# Altium project esc55a.PrjPcb
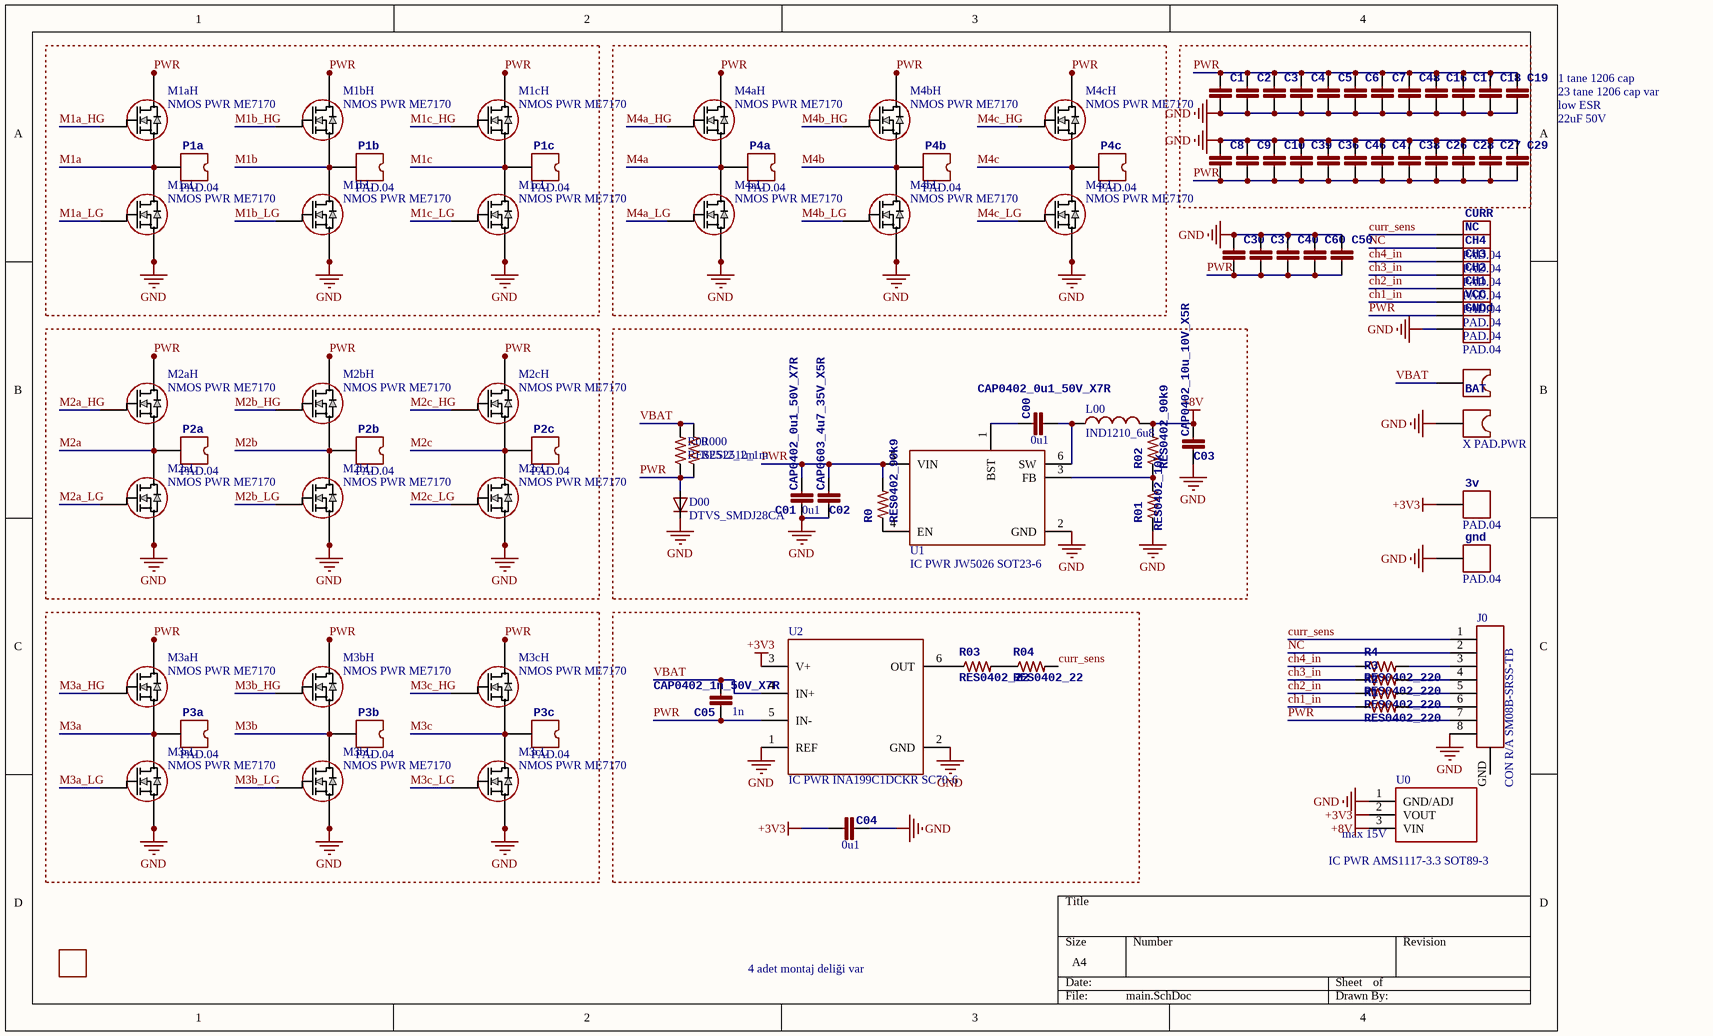
[diagram p0: main.SchDoc]
3 sheets, 232 parts. Net scope: global (net labels, ports and power ports of the same name join across sheets).
Board files: ESC_v0.PcbDoc, escPan.PcbDoc
Sheets:
  main.SchDoc
  mcu.SchDoc
  mcu2.SchDoc

## Sheet main.SchDoc
size A4; SheetNumber: 1; SheetTotal: 3

### Parts
3v  PAD.04  [PAD.04X.04]  (no BOM)
BAT  X PAD.PWR  [PAD6x8]  (no BOM)
C00  CAP0402_0u1_50V_X7R  value 0u1  [0402-CAP]
C1  CAP1206_22u_35V_X5R  [1206-CAP]  (value not drawn)
C01  CAP0402_0u1_50V_X7R  value 0u1  [0402-CAP]
C2  CAP1206_22u_35V_X5R  [1206-CAP]  (value not drawn)
C02  CAP0603_4u7_35V_X5R  [0603-CAP]
C3  CAP1206_22u_35V_X5R  [1206-CAP]  (value not drawn)
C03  CAP0402_10u_10V_X5R  [0402-CAP]
C4  CAP1206_22u_35V_X5R  [1206-CAP]  (value not drawn)
C04  value 0u1  [0402-CAP]  (hidden comment: CAP0402_0u1_16V_X7R)
C5  CAP1206_22u_35V_X5R  [1206-CAP]  (value not drawn)
C05  CAP0402_1n_50V_X7R  value 1n  [0402-CAP]
C6  CAP1206_22u_35V_X5R  [1206-CAP]  (value not drawn)
C7  CAP1206_22u_35V_X5R  [1206-CAP]  (value not drawn)
C8  CAP1206_22u_35V_X5R  [1206-CAP]  (value not drawn)
C9  CAP1206_22u_35V_X5R  [1206-CAP]  (value not drawn)
C10  CAP1206_22u_35V_X5R  [1206-CAP]  (value not drawn)
C16  CAP1206_22u_35V_X5R  [1206-CAP]  (value not drawn)
C17  CAP1206_22u_35V_X5R  [1206-CAP]  (value not drawn)
C18  CAP1206_22u_35V_X5R  [1206-CAP]  (value not drawn)
C19  CAP1206_22u_35V_X5R  [1206-CAP]  (value not drawn)
C26  CAP1206_22u_35V_X5R  [1206-CAP]  (value not drawn)
C27  CAP1206_22u_35V_X5R  [1206-CAP]  (value not drawn)
C28  CAP1206_22u_35V_X5R  [1206-CAP]  (value not drawn)
C29  CAP1206_22u_35V_X5R  [1206-CAP]  (value not drawn)
C30  CAP1206_22u_35V_X5R  [1206-CAP]  (value not drawn)
C36  CAP1206_22u_35V_X5R  [1206-CAP]  (value not drawn)
C37  CAP1206_22u_35V_X5R  [1206-CAP]  (value not drawn)
C38  CAP1206_22u_35V_X5R  [1206-CAP]  (value not drawn)
C39  CAP1206_22u_35V_X5R  [1206-CAP]  (value not drawn)
C40  CAP1206_22u_35V_X5R  [1206-CAP]  (value not drawn)
C46  CAP1206_22u_35V_X5R  [1206-CAP]  (value not drawn)
C47  CAP1206_22u_35V_X5R  [1206-CAP]  (value not drawn)
C48  CAP1206_22u_35V_X5R  [1206-CAP]  (value not drawn)
C50  CAP1206_22u_35V_X5R  [1206-CAP]  (value not drawn)
C60  CAP1206_22u_35V_X5R  [1206-CAP]  (value not drawn)
CH1  PAD.04  [PAD.04X.04]  (no BOM)
CH2  PAD.04  [PAD.04X.04]  (no BOM)
CH3  PAD.04  [PAD.04X.04]  (no BOM)
CH4  PAD.04  [PAD.04X.04]  (no BOM)
CURR  PAD.04  [PAD.04X.04]  (no BOM)
D00  DTVS_SMDJ28CA  [SMC-TVS]
gnd  PAD.04  [PAD.04X.04]  (no BOM)
GNDd  PAD.04  [PAD.04X.04]  (no BOM)
J0  CON R/A SM08B-SRSS-TB  [JST_SM08B-SRSS-TB]
L00  IND1210_6u8  [1210-IND]
LOGO  00 LOGO FTECH  [00FTECH]  (value not drawn)  (no BOM)
M1aH  NMOS PWR ME7170  [8DFN4.9X5.8]
M1aL  NMOS PWR ME7170  [8DFN4.9X5.8]
M1bH  NMOS PWR ME7170  [8DFN4.9X5.8]
M1bL  NMOS PWR ME7170  [8DFN4.9X5.8]
M1cH  NMOS PWR ME7170  [8DFN4.9X5.8]
M1cL  NMOS PWR ME7170  [8DFN4.9X5.8]
M2aH  NMOS PWR ME7170  [8DFN4.9X5.8]
M2aL  NMOS PWR ME7170  [8DFN4.9X5.8]
M2bH  NMOS PWR ME7170  [8DFN4.9X5.8]
M2bL  NMOS PWR ME7170  [8DFN4.9X5.8]
M2cH  NMOS PWR ME7170  [8DFN4.9X5.8]
M2cL  NMOS PWR ME7170  [8DFN4.9X5.8]
M3aH  NMOS PWR ME7170  [8DFN4.9X5.8]
M3aL  NMOS PWR ME7170  [8DFN4.9X5.8]
M3bH  NMOS PWR ME7170  [8DFN4.9X5.8]
M3bL  NMOS PWR ME7170  [8DFN4.9X5.8]
M3cH  NMOS PWR ME7170  [8DFN4.9X5.8]
M3cL  NMOS PWR ME7170  [8DFN4.9X5.8]
M4aH  NMOS PWR ME7170  [8DFN4.9X5.8]
M4aL  NMOS PWR ME7170  [8DFN4.9X5.8]
M4bH  NMOS PWR ME7170  [8DFN4.9X5.8]
M4bL  NMOS PWR ME7170  [8DFN4.9X5.8]
M4cH  NMOS PWR ME7170  [8DFN4.9X5.8]
M4cL  NMOS PWR ME7170  [8DFN4.9X5.8]
NC  PAD.04  [PAD.04X.04]  (no BOM)
P1a  PAD.04  [PAD3.2x3.2]  (no BOM)
P1b  PAD.04  [PAD3.2x3.2]  (no BOM)
P1c  PAD.04  [PAD3.2x3.2]  (no BOM)
P2a  PAD.04  [PAD3.2x3.2]  (no BOM)
P2b  PAD.04  [PAD3.2x3.2]  (no BOM)
P2c  PAD.04  [PAD3.2x3.2]  (no BOM)
P3a  PAD.04  [PAD3.2x3.2]  (no BOM)
P3b  PAD.04  [PAD3.2x3.2]  (no BOM)
P3c  PAD.04  [PAD3.2x3.2]  (no BOM)
P4a  PAD.04  [PAD3.2x3.2]  (no BOM)
P4b  PAD.04  [PAD3.2x3.2]  (no BOM)
P4c  PAD.04  [PAD3.2x3.2]  (no BOM)
R00  RES2512_1m  [2512-RES]
R0  RES0402_90k9  [0402-RES]
R000  RES2512_1m  [2512-RES]
R01  RES0402_10k  [0402-RES]
R1  RES0402_220  [0402-RES]
R2  RES0402_220  [0402-RES]
R02  RES0402_90k9  [0402-RES]
R3  RES0402_220  [0402-RES]
R03  RES0402_22  [0402-RES]
R4  RES0402_220  [0402-RES]
R04  RES0402_22  [0402-RES]
U0  IC PWR AMS1117-3.3 SOT89-3  [SOT89-3]
U1  IC PWR JW5026 SOT23-6  [SOT23-6]
U2  IC PWR INA199C1DCKR SC70-6  [SC70-6]
VCC  PAD.04  [PAD.04X.04]  (no BOM)

### Nets
+3V3: 3v.P$1 C04.P$1 U0.2(VOUT) U2.3(V+)
+8V: C03.P$1 L00.2 R02.P$2 U0.3(VIN)  [project net PVDD]
GND: BAT.P$2 C1.P$2 C01.P$2 C2.P$2 C02.P$2 C3.P$2 C03.P$2 C4.P$2 C04.P$2 C5.P$2 C6.P$2 C7.P$2 C8.P$1 C9.P$1 C10.P$1 C16.P$2 C17.P$2 C18.P$2 C19.P$2 C26.P$1 C27.P$1 C28.P$1 C29.P$1 C30.P$1 C36.P$1 C37.P$1 C38.P$1 C39.P$1 C40.P$1 C46.P$1 C47.P$1 C48.P$2 C50.P$1 C60.P$1 D00.C gnd.P$1 GNDd.P$1 J0.8 M1aL.1 M1aL.2 M1aL.3 M1bL.1 M1bL.2 M1bL.3 M1cL.1 M1cL.2 M1cL.3 M2aL.1 M2aL.2 M2aL.3 M2bL.1 M2bL.2 M2bL.3 M2cL.1 M2cL.2 M2cL.3 M3aL.1 M3aL.2 M3aL.3 M3bL.1 M3bL.2 M3bL.3 M3cL.1 M3cL.2 M3cL.3 M4aL.1 M4aL.2 M4aL.3 M4bL.1 M4bL.2 M4bL.3 M4cL.1 M4cL.2 M4cL.3 R01.P$1 U0.1(GND/ADJ) U1.2(GND) U2.1(REF) U2.2(GND)
ch1_in: CH1.P$1 R1.P$1
ch2_in: CH2.P$1 R2.P$1
ch3_in: CH3.P$1 R3.P$1
ch4_in: CH4.P$1 R4.P$1
curr_sens: CURR.P$1 J0.1 R04.P$2
M1a: M1aH.1 M1aH.2 M1aH.3 M1aL.5 M1aL.6 M1aL.7 M1aL.8 P1a.P$1
M1a_HG: M1aH.4
M1a_LG: M1aL.4
M1b: M1bH.1 M1bH.2 M1bH.3 M1bL.5 M1bL.6 M1bL.7 M1bL.8 P1b.P$1
M1b_HG: M1bH.4
M1b_LG: M1bL.4
M1c: M1cH.1 M1cH.2 M1cH.3 M1cL.5 M1cL.6 M1cL.7 M1cL.8 P1c.P$1
M1c_HG: M1cH.4
M1c_LG: M1cL.4
M2a: M2aH.1 M2aH.2 M2aH.3 M2aL.5 M2aL.6 M2aL.7 M2aL.8 P2a.P$1
M2a_HG: M2aH.4
M2a_LG: M2aL.4
M2b: M2bH.1 M2bH.2 M2bH.3 M2bL.5 M2bL.6 M2bL.7 M2bL.8 P2b.P$1
M2b_HG: M2bH.4
M2b_LG: M2bL.4
M2c: M2cH.1 M2cH.2 M2cH.3 M2cL.5 M2cL.6 M2cL.7 M2cL.8 P2c.P$1
M2c_HG: M2cH.4
M2c_LG: M2cL.4
M3a: M3aH.1 M3aH.2 M3aH.3 M3aL.5 M3aL.6 M3aL.7 M3aL.8 P3a.P$1
M3a_HG: M3aH.4
M3a_LG: M3aL.4
M3b: M3bH.1 M3bH.2 M3bH.3 M3bL.5 M3bL.6 M3bL.7 M3bL.8 P3b.P$1
M3b_HG: M3bH.4
M3b_LG: M3bL.4
M3c: M3cH.1 M3cH.2 M3cH.3 M3cL.5 M3cL.6 M3cL.7 M3cL.8 P3c.P$1
M3c_HG: M3cH.4
M3c_LG: M3cL.4
M4a: M4aH.1 M4aH.2 M4aH.3 M4aL.5 M4aL.6 M4aL.7 M4aL.8 P4a.P$1
M4a_HG: M4aH.4
M4a_LG: M4aL.4
M4b: M4bH.1 M4bH.2 M4bH.3 M4bL.5 M4bL.6 M4bL.7 M4bL.8 P4b.P$1
M4b_HG: M4bH.4
M4b_LG: M4bL.4
M4c: M4cH.1 M4cH.2 M4cH.3 M4cL.5 M4cL.6 M4cL.7 M4cL.8 P4c.P$1
M4c_HG: M4cH.4
M4c_LG: M4cL.4
NC: J0.2 NC.P$1
PWR: C1.P$1 C01.P$1 C2.P$1 C02.P$1 C3.P$1 C4.P$1 C5.P$1 C05.P$2 C6.P$1 C7.P$1 C8.P$2 C9.P$2 C10.P$2 C16.P$1 C17.P$1 C18.P$1 C19.P$1 C26.P$2 C27.P$2 C28.P$2 C29.P$2 C30.P$2 C36.P$2 C37.P$2 C38.P$2 C39.P$2 C40.P$2 C46.P$2 C47.P$2 C48.P$1 C50.P$2 C60.P$2 D00.A J0.7 M1aH.5 M1aH.6 M1aH.7 M1aH.8 M1bH.5 M1bH.6 M1bH.7 M1bH.8 M1cH.5 M1cH.6 M1cH.7 M1cH.8 M2aH.5 M2aH.6 M2aH.7 M2aH.8 M2bH.5 M2bH.6 M2bH.7 M2bH.8 M2cH.5 M2cH.6 M2cH.7 M2cH.8 M3aH.5 M3aH.6 M3aH.7 M3aH.8 M3bH.5 M3bH.6 M3bH.7 M3bH.8 M3cH.5 M3cH.6 M3cH.7 M3cH.8 M4aH.5 M4aH.6 M4aH.7 M4aH.8 M4bH.5 M4bH.6 M4bH.7 M4bH.8 M4cH.5 M4cH.6 M4cH.7 M4cH.8 R00.P$1 R000.P$1 R0.P$2 U1.5(VIN) U2.5(IN-) VCC.P$1
VBAT: BAT.P$1 C05.P$1 R00.P$2 R000.P$2 U2.4(IN+)
NetC00_P$1: C00.P$1 L00.1 U1.6(SW)
NetC00_P$2: C00.P$2 U1.1(BST)
NetJ0_3: J0.3 R4.P$2
NetJ0_4: J0.4 R3.P$2
NetJ0_5: J0.5 R2.P$2
NetJ0_6: J0.6 R1.P$2
NetR0_P$1: R0.P$1 U1.4(EN)
NetR01_P$2: R01.P$2 R02.P$1 U1.3(FB)
NetR03_P$1: R03.P$1 U2.6(OUT)
NetR03_P$2: R03.P$2 R04.P$1

Not connected (* = marked no-connect by the designer): J0 GND

### Notes on the sheet
- (near C19) 23 tane 1206 cap var
- (near C19) 1 tane 1206 cap
- low ESR
- 22uF 50V
- (near U0) max 15V
- 4 adet montaj deliği var

### Library data of the parts
3v CH1-CH4 CURR gnd GNDd NC VCC = X PADS.04
C00 C01 = CAP0402_0u1_50V_X7R: 50V 100nF X7R ±10% 0402 Multilayer Ceramic Capacitors MLCC - SMD/SMT ROHS; Manufacturer Product Number: GRM155R71H104KE14D; LSCS Part Number: C77020; Voltage Rating: 50; Package: 0402; Digikey Part Number: 490-10700-1-ND
C1-C10 C16-C19 C26-C30 C36-C40 C46-C48 C50 C60 = CAP1206_22u_35V_X5R: CAP CER 22UF 35V 20% X5R 1206; Manufacturer Product Number: C3216X5R1V226M160AC; LSCS Part Number: C342620; Voltage Rating: 35; Value: 22uF; Digikey Part Number: 445-8045-1-ND; Package: 1206
C02 = CAP0603_4u7_35V_X5R: 35V 4.7uF X5R ±10% 0603 Multilayer Ceramic Capacitors MLCC - SMD/SMT ROHS; Manufacturer Product Number: GRM188R6YA475KE15D; LSCS Part Number: C162274; Value: 4.7u; Package: 0603; Voltage Rating: 35V; Digikey Part Number: 490-7205-1-ND
C03 = CAP0402_10u_10V_X5R: 10V 10uF X5R ±20% 0402 Multilayer Ceramic Capacitors MLCC - SMD/SMT ROHS; Manufacturer Product Number: GRM155R61A106ME44D; LSCS Part Number: C77000; Value: 10u; Package: 0402; Voltage Rating: 10V; Digikey Part Number: N/A
C04 = CAP0402_0u1_16V_X7R: X7R 100nF 16V ±10% 0402 Multilayer Ceramic Capacitors MLCC - SMD/SMT ROHS; Manufacturer Product Number: CL05B104KO3LNNC; LSCS Part Number: C1525; Voltage Rating: 16; Digikey Part Number: 1276-1507-1-ND; Package: 0402
C05 = CAP0402_1n_50V_X7R: 50V 1nF X7R ±10% 0402 Multilayer Ceramic Capacitors MLCC - SMD/SMT ROHS; Manufacturer Product Number: CC0402KRX7R9BB102; LSCS Part Number: C106205; Voltage Rating: 50; Package: 0402; Digikey Part Number: 311-1036-1-ND
D00 = DTVS_SMDJ28CA: 66.1A 45.4V 3kW 31.1V 28V SMC ESD and Surge Protection (TVS/ESD) ROHS; LSCS Part Number: C2990249; Digikey Part Number: SMDJ28CACT-ND; Manufacturer Product Number: SMDJ28CA; Package: SMC, DO214AB
J0 = CON R/A SM08B-SRSS-TB: SH Series 8 Position 1 mm Pitch Surface Mount Side Entry Shrouded Header Right Angle / CONN HEADER SMD R/A 8POS 1MM; LSCS Part Number: C2763618; Manufacturer Product Number: SM08B-SRSS-TB; Digikey Part Number: 455-1808-1-ND
L00 = IND1210_6u8: 1.6A 6.8uH ±20% 1.8A 220mΩ 1210 Inductors (SMD) ROHS; Manufacturer Product Number: TFM322512ALMA6R8MTAA; LSCS Part Number: C2047644; Package: 1210; Value: 6.8uH; Digikey Part Number: 445-TFM322512ALMA6R8MTAACT-ND
M1aH M1aL M1bH M1bL M1cH M1cL M2aH M2aL M2bH M2bL M2cH M2cL M3aH M3aL M3bH M3bL M3cH M3cL M4aH M4aL M4bH M4bL M4cH M4cL = NMOS PWR ME7170: 30V 90A NMOS 3.9mΩ@4.5V,19A 36W 2.2V DFN-8(4.9x5.8) MOSFETs ROHS; LSCS Part Number: C2841360; Manufacturer Product Number: ME7170; Package: 8DFN(4.9x5.8); Digikey Part Number: N/A
P1a P1b P1c P2a P2b P2c P3a P3b P3c P4a P4b P4c = X PAD.ESC
R00 R000 = RES2512_1m: 2W 1mΩ Current Sensing Resistors ±50ppm/℃ ±1% 2512 Current Sense Resistors / Shunt Resistors ROHS; Manufacturer Product Number: PA2512FKE7W0R001E; LSCS Part Number: C326570; Value: 1m; Digikey Part Number: YAG6089CT-ND; Package: 2512
R0 R02 = RES0402_90k9: 62.5mW Thick Film Resistors 50V ±100ppm/℃ ±1% 90.9kΩ 0402 Chip Resistor - Surface Mount ROHS; Manufacturer Product Number: RC0402FR-0790K9L; LSCS Part Number: C163452; Value: 90.9k; Package: 0402; Digikey Part Number: 311-90.9KLRCT-ND
R01 = RES0402_10k: 50V Thick Film Resistors 62.5mW 110kΩ ±1% ±100ppm/℃ 0402 Chip Resistor - Surface Mount ROHS; Manufacturer Product Number: RC0402FR-0710KL; LSCS Part Number: C60490; Value: 10k; Package: 0402; Digikey Part Number: 311-10.0KLRCT-ND
R1-R4 = RES0402_220: 62.5mW Thick Film Resistors 50V ±100ppm/℃ ±1% 220Ω 0402 Chip Resistor - Surface Mount ROHS; Manufacturer Product Number: RC0402FR-07220RL; LSCS Part Number: C112291; Value: 220; Package: 0402; Digikey Part Number: 311-220LRCT-ND
R03 R04 = RES0402_22: 62.5mW Thick Film Resistors 50V ±1% ±100ppm/℃ 22Ω 0402 Chip Resistor - Surface Mount ROHS; Manufacturer Product Number: RC0402FR-0722RL; LSCS Part Number: C114765; Value: 22; Package: 0402; Digikey Part Number: 311-22.0LRCT-ND
U0 = IC PWR AMS1117-3.3 SOT89-3: IC LDO REG 3.3V 1A 15Vinmax SOT89-3; LSCS Part Number: C22472154; Voltage Rating: 15V; Manufacturer Product Number: AMS1117-3.3; Package: SOT89-3; Digikey Part Number: 5272-AMS1117-3.3SCT-ND; Output Voltage: 3.3V; Output Current: 1A
U1 = IC PWR JW5026 SOT23-6: Step-down type 1A 4.7V~40V SOT-23-6 DC-DC Converters ROHS; LSCS Part Number: C185109; Manufacturer Product Number: JW5026; Package: SOT23-6; Digikey Part Number: N/A
U2 = IC PWR INA199C1DCKR SC70-6: Current Sense Regulator High/Low-Side SC-70-6; LSCS Part Number: C2155860; Manufacturer Product Number: INA199C1DCKR; Package: SC70-6; Digikey Part Number: 296-47775-1-ND

## Sheet mcu.SchDoc
size A4; SheetNumber: 2; SheetTotal: 3
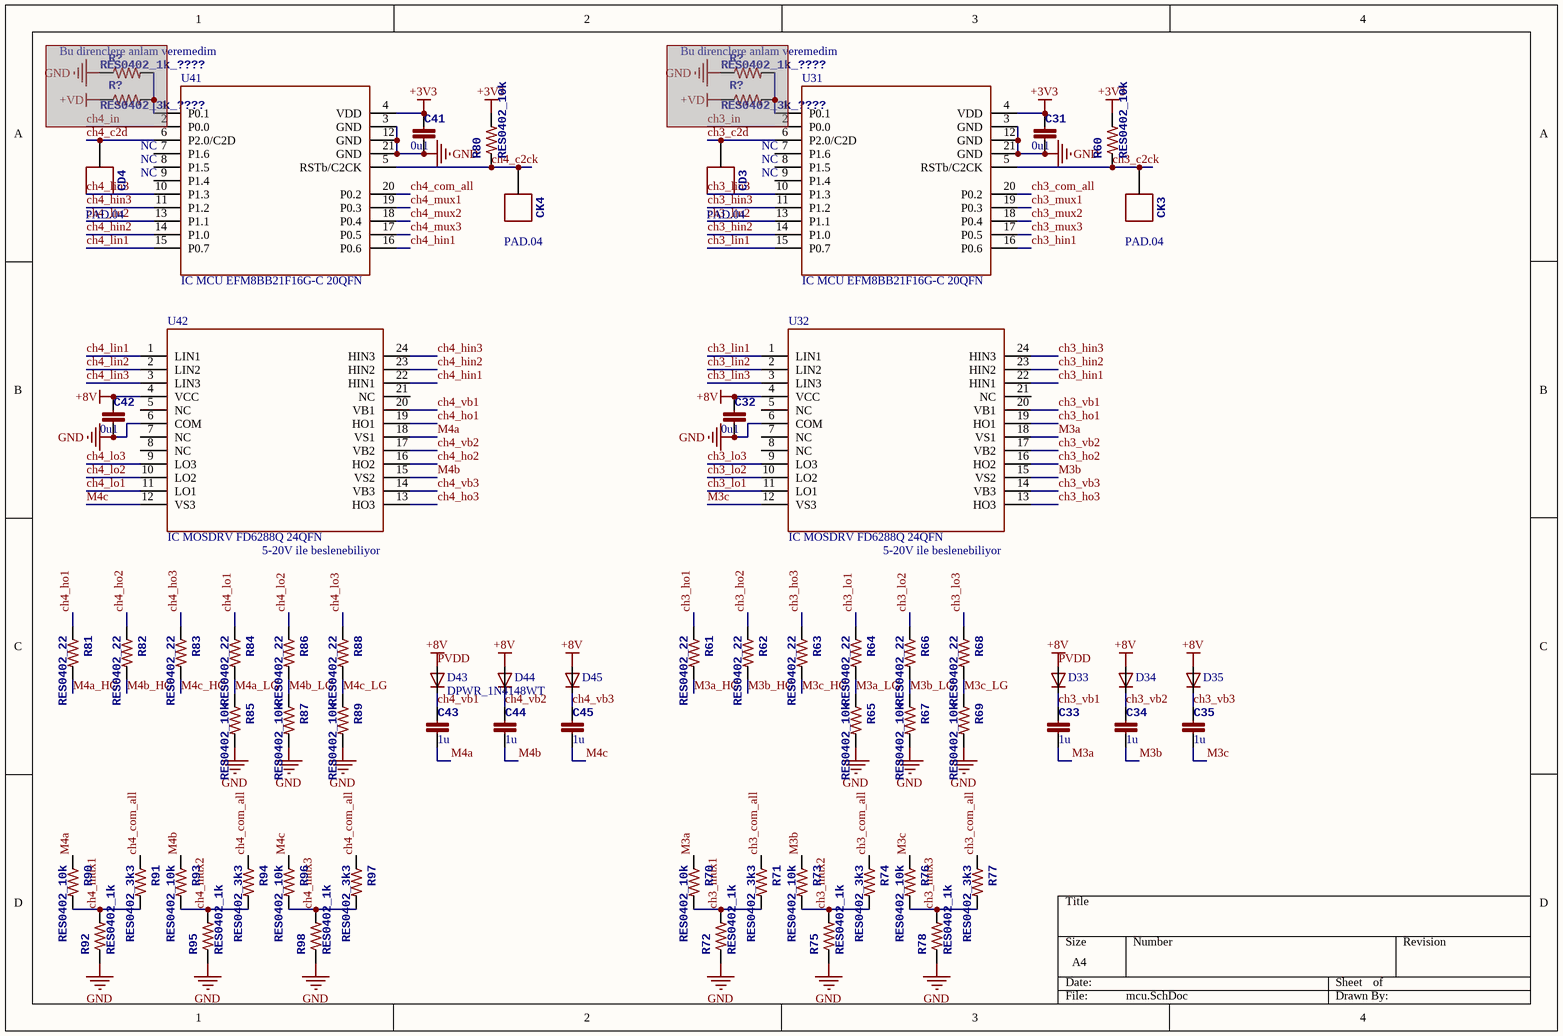
[diagram p1: mcu.SchDoc]

### Parts
(Parts that share a designator on the sheet are numbered #1, #2 ... from top to bottom, then left to right.)
C31  value 0u1  [0402-CAP]  (hidden comment: CAP0402_0u1_16V_X7R)
C32  value 0u1  [0402-CAP]  (hidden comment: CAP0402_0u1_16V_X7R)
C33  value 1u  [0402-CAP]  (hidden comment: CAP0402_1u_16V_X5R)
C34  value 1u  [0402-CAP]  (hidden comment: CAP0402_1u_16V_X5R)
C35  value 1u  [0402-CAP]  (hidden comment: CAP0402_1u_16V_X5R)
C41  value 0u1  [0402-CAP]  (hidden comment: CAP0402_0u1_16V_X7R)
C42  value 0u1  [0402-CAP]  (hidden comment: CAP0402_0u1_16V_X7R)
C43  value 1u  [0402-CAP]  (hidden comment: CAP0402_1u_16V_X5R)
C44  value 1u  [0402-CAP]  (hidden comment: CAP0402_1u_16V_X5R)
C45  value 1u  [0402-CAP]  (hidden comment: CAP0402_1u_16V_X5R)
CD3  PAD.04  [PAD.04X.04]  (no BOM)
CD4  PAD.04  [PAD.04X.04]  (no BOM)
CK3  PAD.04  [PAD.04X.04]  (no BOM)
CK4  PAD.04  [PAD.04X.04]  (no BOM)
D33  DPWR_1N4148WT  [SOD-523_0P9X1P3]  (value not drawn)
D34  DPWR_1N4148WT  [SOD-523_0P9X1P3]  (value not drawn)
D35  DPWR_1N4148WT  [SOD-523_0P9X1P3]  (value not drawn)
D43  DPWR_1N4148WT  [SOD-523_0P9X1P3]
D44  DPWR_1N4148WT  [SOD-523_0P9X1P3]  (value not drawn)
D45  DPWR_1N4148WT  [SOD-523_0P9X1P3]  (value not drawn)
R60  RES0402_10k  [0402-RES]
R61  RES0402_22  [0402-RES]
R62  RES0402_22  [0402-RES]
R63  RES0402_22  [0402-RES]
R64  RES0402_22  [0402-RES]
R65  RES0402_10k  [0402-RES]
R66  RES0402_22  [0402-RES]
R67  RES0402_10k  [0402-RES]
R68  RES0402_22  [0402-RES]
R69  RES0402_10k  [0402-RES]
R70  RES0402_10k  [0402-RES]
R71  RES0402_3k3  [0402-RES]
R72  RES0402_1k  [0402-RES]
R73  RES0402_10k  [0402-RES]
R74  RES0402_3k3  [0402-RES]
R75  RES0402_1k  [0402-RES]
R76  RES0402_10k  [0402-RES]
R77  RES0402_3k3  [0402-RES]
R78  RES0402_1k  [0402-RES]
R80  RES0402_10k  [0402-RES]
R81  RES0402_22  [0402-RES]
R82  RES0402_22  [0402-RES]
R83  RES0402_22  [0402-RES]
R84  RES0402_22  [0402-RES]
R85  RES0402_10k  [0402-RES]
R86  RES0402_22  [0402-RES]
R87  RES0402_10k  [0402-RES]
R88  RES0402_22  [0402-RES]
R89  RES0402_10k  [0402-RES]
R90  RES0402_10k  [0402-RES]
R91  RES0402_3k3  [0402-RES]
R92  RES0402_1k  [0402-RES]
R93  RES0402_10k  [0402-RES]
R94  RES0402_3k3  [0402-RES]
R95  RES0402_1k  [0402-RES]
R96  RES0402_10k  [0402-RES]
R97  RES0402_3k3  [0402-RES]
R98  RES0402_1k  [0402-RES]
R?#1  RES0402_1k_????  [0402-RES]  (masked out: inside a compile mask, not in the netlist)
R?#2  RES0402_1k_????  [0402-RES]  (masked out: inside a compile mask, not in the netlist)
R?#3  RES0402_3k_????  [0402-RES]  (masked out: inside a compile mask, not in the netlist)
R?#4  RES0402_3k_????  [0402-RES]  (masked out: inside a compile mask, not in the netlist)
U31  IC MCU EFM8BB21F16G-C 20QFN  [QFN20_3X3_SIL]
U32  IC MOSDRV FD6288Q 24QFN  [QFN-24(4x4)]
U41  IC MCU EFM8BB21F16G-C 20QFN  [QFN20_3X3_SIL]
U42  IC MOSDRV FD6288Q 24QFN  [QFN-24(4x4)]

### Nets
+3V3: C31.P$1 C41.P$1 R60.P$2 R80.P$2 U31.4(VDD) U41.4(VDD)
GND: C31.P$2 C32.P$2 C41.P$2 C42.P$2 R65.P$2 R67.P$2 R69.P$2 R72.P$1 R75.P$1 R78.P$1 R85.P$2 R87.P$2 R89.P$2 R92.P$1 R95.P$1 R98.P$1 U31.3(GND) U31.12(GND) U31.21(GND) U32.6(COM) U41.3(GND) U41.12(GND) U41.21(GND) U42.6(COM)
PVDD: C32.P$1 C42.P$1 D33.A D34.A D35.A D43.A D44.A D45.A U32.4(VCC) U42.4(VCC)  [also labelled +8V]
ch3_c2ck: CK3.P$1 R60.P$1 U31.5(RSTb/C2CK)
ch3_c2d: CD3.P$1 U31.6(P2.0/C2D)
ch3_com_all: R71.P$1 R74.P$1 R77.P$1 U31.20(P0.2)
ch3_hin1: U31.16(P0.6) U32.22(HIN1)
ch3_hin2: U31.14(P1.0) U32.23(HIN2)
ch3_hin3: U31.11(P1.2) U32.24(HIN3)
ch3_ho1: R61.P$1 U32.19(HO1)
ch3_ho2: R62.P$1 U32.16(HO2)
ch3_ho3: R63.P$1 U32.13(HO3)
ch3_lin1: U31.15(P0.7) U32.1(LIN1)
ch3_lin2: U31.13(P1.1) U32.2(LIN2)
ch3_lin3: U31.10(P1.3) U32.3(LIN3)
ch3_lo1: R64.P$1 U32.11(LO1)
ch3_lo2: R66.P$1 U32.10(LO2)
ch3_lo3: R68.P$1 U32.9(LO3)
ch3_mux1: R70.P$2 R71.P$2 R72.P$2 U31.19(P0.3)
ch3_mux2: R73.P$2 R74.P$2 R75.P$2 U31.18(P0.4)
ch3_mux3: R76.P$2 R77.P$2 R78.P$2 U31.17(P0.5)
ch3_vb1: C33.P$1 D33.K U32.20(VB1)
ch3_vb2: C34.P$1 D34.K U32.17(VB2)
ch3_vb3: C35.P$1 D35.K U32.14(VB3)
ch4_c2ck: CK4.P$1 R80.P$1 U41.5(RSTb/C2CK)
ch4_c2d: CD4.P$1 U41.6(P2.0/C2D)
ch4_com_all: R91.P$1 R94.P$1 R97.P$1 U41.20(P0.2)
ch4_hin1: U41.16(P0.6) U42.22(HIN1)
ch4_hin2: U41.14(P1.0) U42.23(HIN2)
ch4_hin3: U41.11(P1.2) U42.24(HIN3)
ch4_ho1: R81.P$1 U42.19(HO1)
ch4_ho2: R82.P$1 U42.16(HO2)
ch4_ho3: R83.P$1 U42.13(HO3)
ch4_lin1: U41.15(P0.7) U42.1(LIN1)
ch4_lin2: U41.13(P1.1) U42.2(LIN2)
ch4_lin3: U41.10(P1.3) U42.3(LIN3)
ch4_lo1: R84.P$1 U42.11(LO1)
ch4_lo2: R86.P$1 U42.10(LO2)
ch4_lo3: R88.P$1 U42.9(LO3)
ch4_mux1: R90.P$2 R91.P$2 R92.P$2 U41.19(P0.3)
ch4_mux2: R93.P$2 R94.P$2 R95.P$2 U41.18(P0.4)
ch4_mux3: R96.P$2 R97.P$2 R98.P$2 U41.17(P0.5)
ch4_vb1: C43.P$1 D43.K U42.20(VB1)
ch4_vb2: C44.P$1 D44.K U42.17(VB2)
ch4_vb3: C45.P$1 D45.K U42.14(VB3)
M3a: C33.P$2 R70.P$1 U32.18(VS1)
M3a_HG: R61.P$2
M3a_LG: R64.P$2 R65.P$1
M3b: C34.P$2 R73.P$1 U32.15(VS2)
M3b_HG: R62.P$2
M3b_LG: R66.P$2 R67.P$1
M3c: C35.P$2 R76.P$1 U32.12(VS3)
M3c_HG: R63.P$2
M3c_LG: R68.P$2 R69.P$1
M4a: C43.P$2 R90.P$1 U42.18(VS1)
M4a_HG: R81.P$2
M4a_LG: R84.P$2 R85.P$1
M4b: C44.P$2 R93.P$1 U42.15(VS2)
M4b_HG: R82.P$2
M4b_LG: R86.P$2 R87.P$1
M4c: C45.P$2 R96.P$1 U42.12(VS3)
M4c_HG: R83.P$2
M4c_LG: R88.P$2 R89.P$1

Not connected (* = marked no-connect by the designer): U31 1(P0.1) 2(P0.0) 7(P1.6) 8(P1.5) 9(P1.4); U32 5(NC) 7(NC) 8(NC) 21(NC); U41 1(P0.1) 2(P0.0) 7(P1.6) 8(P1.5) 9(P1.4); U42 5(NC) 7(NC) 8(NC) 21(NC)

### Notes on the sheet
- (near R?#1) Bu direnclere anlam veremedim
- (near R?#2) Bu direnclere anlam veremedim
- NC
- (near U42) 5-20V ile beslenebiliyor
- (near U32) 5-20V ile beslenebiliyor

### Library data of the parts
C31 C32 C41 C42 = CAP0402_0u1_16V_X7R: as C04 on sheet main; Digikey Part Number: 1276-1507-1-ND; Package: 0402
C33-C35 C43-C45 = CAP0402_1u_16V_X5R: X5R 1uF 16V ±10% 0402 Multilayer Ceramic Capacitors MLCC - SMD/SMT ROHS; Manufacturer Product Number: CL05A105KO5NNNC; LSCS Part Number: C29266; Digikey Part Number: 1276-1067-1-ND; Package: 0402; Voltage Rating: 16V
CD3 CD4 CK3 CK4 = X PADS.04
D33-D35 D43-D45 = DPWR_1N4148WT: 75V Independent Type 1.25V@150mA 4ns 150mA SOD-523 Switching Diodes ROHS; LSCS Part Number: C917006; Manufacturer Product Number: 1N4148WT; Package: SOD523; Digikey Part Number: 1N4148WTCT-ND
R60 R65 R67 R69 R70 R73 R76 R80 R85 R87 R89 R90 R93 R96 = RES0402_10k: as R01 on sheet main; Package: 0402; Digikey Part Number: 311-10.0KLRCT-ND
R61-R64 R66 R68 R81-R84 R86 R88 = RES0402_22: as R03 on sheet main; Package: 0402; Digikey Part Number: 311-22.0LRCT-ND
R71 R74 R77 R91 R94 R97 = RES0402_3k3: 62.5mW Thick Film Resistors 50V ±100ppm/℃ ±1% 3.3kΩ 0402 Chip Resistor - Surface Mount ROHS; Manufacturer Product Number: RC0402FR-073K3L; LSCS Part Number: C137992; Value: 3k3; Package: 0402; Digikey Part Number: 1712-CRG0402F3K3CT-ND
R72 R75 R78 R92 R95 R98 = RES0402_1k: 62.5mW Thick Film Resistors 50V ±100ppm/℃ ±1% 1kΩ 0402 Chip Resistor - Surface Mount ROHS; Manufacturer Product Number: RC0402JR-071KL; LSCS Part Number: C105637; Value: 1k; Package: 0402; Digikey Part Number: 311-1.0KJRCT-ND
R?#1 R?#2 = RES0402_1k_????: Value: 1k; Supplier Part Number 1: *; Manufacturer Product Number: *; Supplier Part Number 2: *; Package: 0402
R?#3 R?#4 = RES0402_3k_????: Value: 3k; Supplier Part Number 1: *; Manufacturer Product Number: *; Supplier Part Number 2: *; Package: 0402
U31 U41 = IC MCU EFM8BB21F16G-C 20QFN: IC MCU 8BIT 16KB FLASH 20QFN; LSCS Part Number: C80713; Manufacturer Product Number: EFM8BB21F16G-C-QFN20R; Digikey Part Number: 336-4743-1-ND; Package: 20QFN
U32 U42 = IC MOSDRV FD6288Q 24QFN: High and low sides MOSFET 1.8A 8V~20V 1.5A QFN-24 Gate Drivers ROHS; LSCS Part Number: C328453; Digikey Part Number: N/A; Package: 24QFN(4x4); Manufacturer Product Number: FD6288Q

## Sheet mcu2.SchDoc
size A4; SheetNumber: 3; SheetTotal: 3
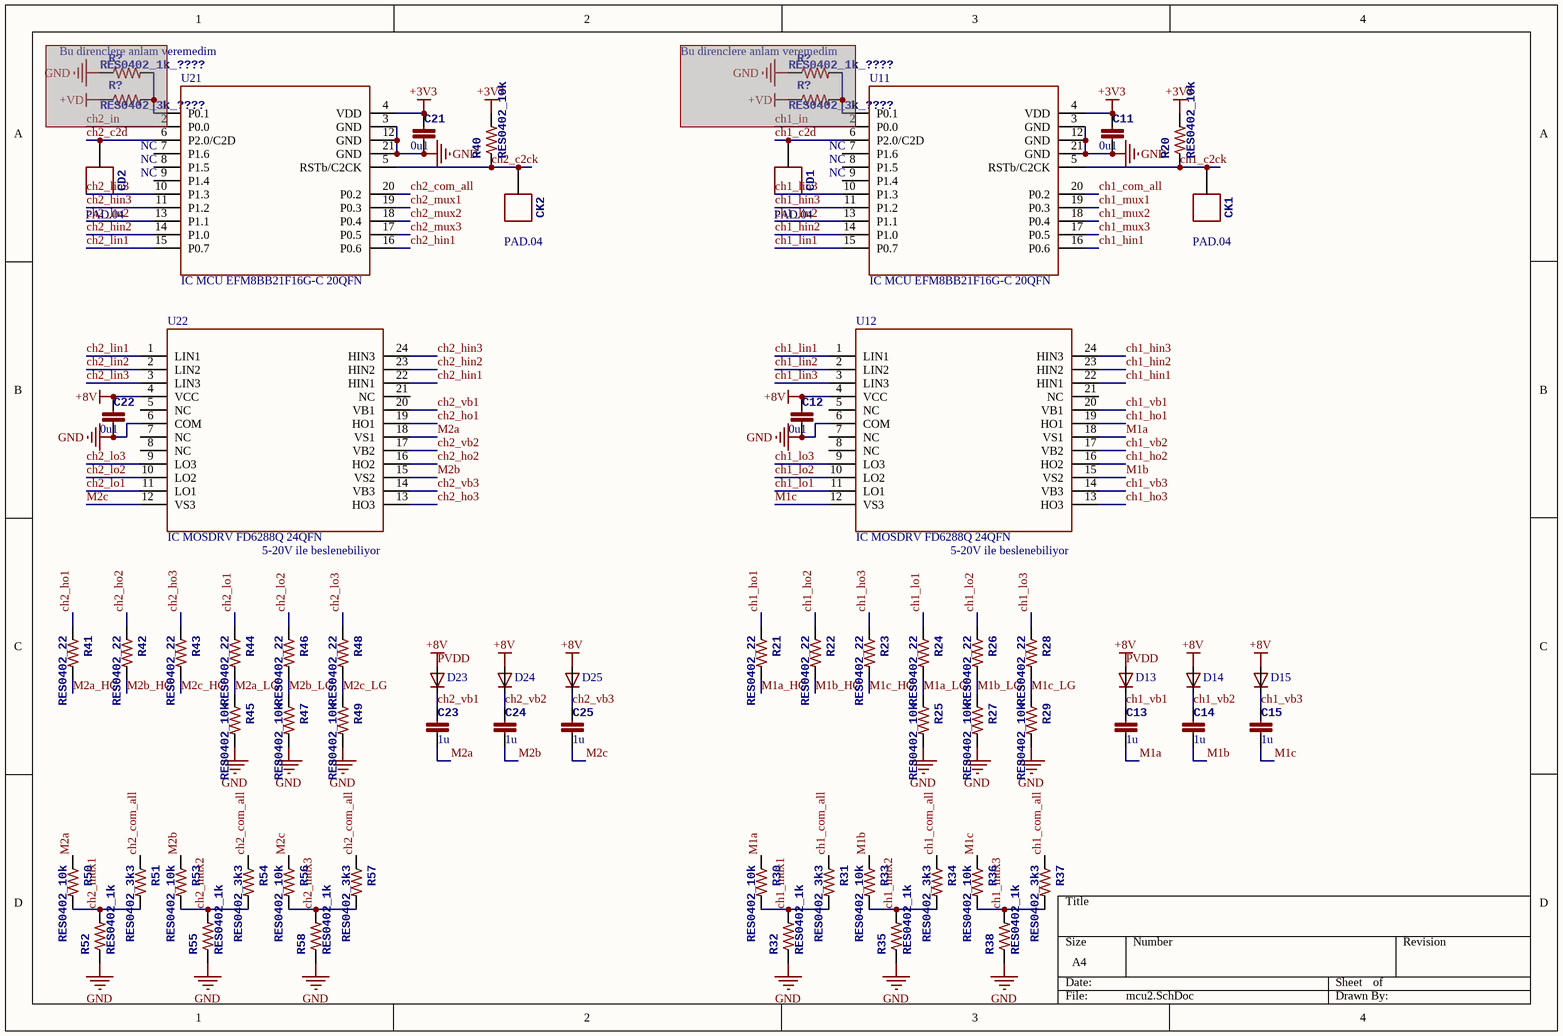
[diagram p2: mcu2.SchDoc]

### Parts
(Parts that share a designator on the sheet are numbered #1, #2 ... from top to bottom, then left to right.)
C11  value 0u1  [0402-CAP]  (hidden comment: CAP0402_0u1_16V_X7R)
C12  value 0u1  [0402-CAP]  (hidden comment: CAP0402_0u1_16V_X7R)
C13  value 1u  [0402-CAP]  (hidden comment: CAP0402_1u_16V_X5R)
C14  value 1u  [0402-CAP]  (hidden comment: CAP0402_1u_16V_X5R)
C15  value 1u  [0402-CAP]  (hidden comment: CAP0402_1u_16V_X5R)
C21  value 0u1  [0402-CAP]  (hidden comment: CAP0402_0u1_16V_X7R)
C22  value 0u1  [0402-CAP]  (hidden comment: CAP0402_0u1_16V_X7R)
C23  value 1u  [0402-CAP]  (hidden comment: CAP0402_1u_16V_X5R)
C24  value 1u  [0402-CAP]  (hidden comment: CAP0402_1u_16V_X5R)
C25  value 1u  [0402-CAP]  (hidden comment: CAP0402_1u_16V_X5R)
CD1  PAD.04  [PAD.04X.04]  (no BOM)
CD2  PAD.04  [PAD.04X.04]  (no BOM)
CK1  PAD.04  [PAD.04X.04]  (no BOM)
CK2  PAD.04  [PAD.04X.04]  (no BOM)
D13  DPWR_1N4148WT  [SOD-523_0P9X1P3]  (value not drawn)
D14  DPWR_1N4148WT  [SOD-523_0P9X1P3]  (value not drawn)
D15  DPWR_1N4148WT  [SOD-523_0P9X1P3]  (value not drawn)
D23  DPWR_1N4148WT  [SOD-523_0P9X1P3]  (value not drawn)
D24  DPWR_1N4148WT  [SOD-523_0P9X1P3]  (value not drawn)
D25  DPWR_1N4148WT  [SOD-523_0P9X1P3]  (value not drawn)
R20  RES0402_10k  [0402-RES]
R21  RES0402_22  [0402-RES]
R22  RES0402_22  [0402-RES]
R23  RES0402_22  [0402-RES]
R24  RES0402_22  [0402-RES]
R25  RES0402_10k  [0402-RES]
R26  RES0402_22  [0402-RES]
R27  RES0402_10k  [0402-RES]
R28  RES0402_22  [0402-RES]
R29  RES0402_10k  [0402-RES]
R30  RES0402_10k  [0402-RES]
R31  RES0402_3k3  [0402-RES]
R32  RES0402_1k  [0402-RES]
R33  RES0402_10k  [0402-RES]
R34  RES0402_3k3  [0402-RES]
R35  RES0402_1k  [0402-RES]
R36  RES0402_10k  [0402-RES]
R37  RES0402_3k3  [0402-RES]
R38  RES0402_1k  [0402-RES]
R40  RES0402_10k  [0402-RES]
R41  RES0402_22  [0402-RES]
R42  RES0402_22  [0402-RES]
R43  RES0402_22  [0402-RES]
R44  RES0402_22  [0402-RES]
R45  RES0402_10k  [0402-RES]
R46  RES0402_22  [0402-RES]
R47  RES0402_10k  [0402-RES]
R48  RES0402_22  [0402-RES]
R49  RES0402_10k  [0402-RES]
R50  RES0402_10k  [0402-RES]
R51  RES0402_3k3  [0402-RES]
R52  RES0402_1k  [0402-RES]
R53  RES0402_10k  [0402-RES]
R54  RES0402_3k3  [0402-RES]
R55  RES0402_1k  [0402-RES]
R56  RES0402_10k  [0402-RES]
R57  RES0402_3k3  [0402-RES]
R58  RES0402_1k  [0402-RES]
R?#5  RES0402_1k_????  [0402-RES]  (masked out: inside a compile mask, not in the netlist)
R?#6  RES0402_1k_????  [0402-RES]  (masked out: inside a compile mask, not in the netlist)
R?#7  RES0402_3k_????  [0402-RES]  (masked out: inside a compile mask, not in the netlist)
R?#8  RES0402_3k_????  [0402-RES]  (masked out: inside a compile mask, not in the netlist)
U11  IC MCU EFM8BB21F16G-C 20QFN  [QFN20_3X3_SIL]
U12  IC MOSDRV FD6288Q 24QFN  [QFN-24(4x4)]
U21  IC MCU EFM8BB21F16G-C 20QFN  [QFN20_3X3_SIL]
U22  IC MOSDRV FD6288Q 24QFN  [QFN-24(4x4)]

### Nets
+3V3: C11.P$1 C21.P$1 R20.P$2 R40.P$2 U11.4(VDD) U21.4(VDD)
GND: C11.P$2 C12.P$2 C21.P$2 C22.P$2 R25.P$2 R27.P$2 R29.P$2 R32.P$1 R35.P$1 R38.P$1 R45.P$2 R47.P$2 R49.P$2 R52.P$1 R55.P$1 R58.P$1 U11.3(GND) U11.12(GND) U11.21(GND) U12.6(COM) U21.3(GND) U21.12(GND) U21.21(GND) U22.6(COM)
PVDD: C12.P$1 C22.P$1 D13.A D14.A D15.A D23.A D24.A D25.A U12.4(VCC) U22.4(VCC)  [also labelled +8V]
ch1_c2ck: CK1.P$1 R20.P$1 U11.5(RSTb/C2CK)
ch1_c2d: CD1.P$1 U11.6(P2.0/C2D)
ch1_com_all: R31.P$1 R34.P$1 R37.P$1 U11.20(P0.2)
ch1_hin1: U11.16(P0.6) U12.22(HIN1)
ch1_hin2: U11.14(P1.0) U12.23(HIN2)
ch1_hin3: U11.11(P1.2) U12.24(HIN3)
ch1_ho1: R21.P$1 U12.19(HO1)
ch1_ho2: R22.P$1 U12.16(HO2)
ch1_ho3: R23.P$1 U12.13(HO3)
ch1_lin1: U11.15(P0.7) U12.1(LIN1)
ch1_lin2: U11.13(P1.1) U12.2(LIN2)
ch1_lin3: U11.10(P1.3) U12.3(LIN3)
ch1_lo1: R24.P$1 U12.11(LO1)
ch1_lo2: R26.P$1 U12.10(LO2)
ch1_lo3: R28.P$1 U12.9(LO3)
ch1_mux1: R30.P$2 R31.P$2 R32.P$2 U11.19(P0.3)
ch1_mux2: R33.P$2 R34.P$2 R35.P$2 U11.18(P0.4)
ch1_mux3: R36.P$2 R37.P$2 R38.P$2 U11.17(P0.5)
ch1_vb1: C13.P$1 D13.K U12.20(VB1)
ch1_vb2: C14.P$1 D14.K U12.17(VB2)
ch1_vb3: C15.P$1 D15.K U12.14(VB3)
ch2_c2ck: CK2.P$1 R40.P$1 U21.5(RSTb/C2CK)
ch2_c2d: CD2.P$1 U21.6(P2.0/C2D)
ch2_com_all: R51.P$1 R54.P$1 R57.P$1 U21.20(P0.2)
ch2_hin1: U21.16(P0.6) U22.22(HIN1)
ch2_hin2: U21.14(P1.0) U22.23(HIN2)
ch2_hin3: U21.11(P1.2) U22.24(HIN3)
ch2_ho1: R41.P$1 U22.19(HO1)
ch2_ho2: R42.P$1 U22.16(HO2)
ch2_ho3: R43.P$1 U22.13(HO3)
ch2_lin1: U21.15(P0.7) U22.1(LIN1)
ch2_lin2: U21.13(P1.1) U22.2(LIN2)
ch2_lin3: U21.10(P1.3) U22.3(LIN3)
ch2_lo1: R44.P$1 U22.11(LO1)
ch2_lo2: R46.P$1 U22.10(LO2)
ch2_lo3: R48.P$1 U22.9(LO3)
ch2_mux1: R50.P$2 R51.P$2 R52.P$2 U21.19(P0.3)
ch2_mux2: R53.P$2 R54.P$2 R55.P$2 U21.18(P0.4)
ch2_mux3: R56.P$2 R57.P$2 R58.P$2 U21.17(P0.5)
ch2_vb1: C23.P$1 D23.K U22.20(VB1)
ch2_vb2: C24.P$1 D24.K U22.17(VB2)
ch2_vb3: C25.P$1 D25.K U22.14(VB3)
M1a: C13.P$2 R30.P$1 U12.18(VS1)
M1a_HG: R21.P$2
M1a_LG: R24.P$2 R25.P$1
M1b: C14.P$2 R33.P$1 U12.15(VS2)
M1b_HG: R22.P$2
M1b_LG: R26.P$2 R27.P$1
M1c: C15.P$2 R36.P$1 U12.12(VS3)
M1c_HG: R23.P$2
M1c_LG: R28.P$2 R29.P$1
M2a: C23.P$2 R50.P$1 U22.18(VS1)
M2a_HG: R41.P$2
M2a_LG: R44.P$2 R45.P$1
M2b: C24.P$2 R53.P$1 U22.15(VS2)
M2b_HG: R42.P$2
M2b_LG: R46.P$2 R47.P$1
M2c: C25.P$2 R56.P$1 U22.12(VS3)
M2c_HG: R43.P$2
M2c_LG: R48.P$2 R49.P$1

Not connected (* = marked no-connect by the designer): U11 1(P0.1) 2(P0.0) 7(P1.6) 8(P1.5) 9(P1.4); U12 5(NC) 7(NC) 8(NC) 21(NC); U21 1(P0.1) 2(P0.0) 7(P1.6) 8(P1.5) 9(P1.4); U22 5(NC) 7(NC) 8(NC) 21(NC)

### Notes on the sheet
- (near R?#5) Bu direnclere anlam veremedim
- (near R?#6) Bu direnclere anlam veremedim
- NC
- (near U22) 5-20V ile beslenebiliyor
- (near U12) 5-20V ile beslenebiliyor

### Library data of the parts
C11 C12 C21 C22 = CAP0402_0u1_16V_X7R: as C04 on sheet main; Digikey Part Number: 1276-1507-1-ND; Package: 0402
C13-C15 C23-C25 = CAP0402_1u_16V_X5R: as C33 on sheet mcu; Digikey Part Number: 1276-1067-1-ND; Package: 0402; Voltage Rating: 16V
CD1 CD2 CK1 CK2 = X PADS.04
D13-D15 D23-D25 = DPWR_1N4148WT: as D33 on sheet mcu; Manufacturer Product Number: 1N4148WT; Package: SOD523; Digikey Part Number: 1N4148WTCT-ND
R20 R25 R27 R29 R30 R33 R36 R40 R45 R47 R49 R50 R53 R56 = RES0402_10k: as R01 on sheet main; Package: 0402; Digikey Part Number: 311-10.0KLRCT-ND
R21-R24 R26 R28 R41-R44 R46 R48 = RES0402_22: as R03 on sheet main; Package: 0402; Digikey Part Number: 311-22.0LRCT-ND
R31 R34 R37 R51 R54 R57 = RES0402_3k3: as R71 on sheet mcu; Package: 0402; Digikey Part Number: 1712-CRG0402F3K3CT-ND
R32 R35 R38 R52 R55 R58 = RES0402_1k: as R72 on sheet mcu; Package: 0402; Digikey Part Number: 311-1.0KJRCT-ND
R?#5 R?#6 = RES0402_1k_????: Value: 1k; Supplier Part Number 1: *; Manufacturer Product Number: *; Supplier Part Number 2: *; Package: 0402
R?#7 R?#8 = RES0402_3k_????: Value: 3k; Supplier Part Number 1: *; Manufacturer Product Number: *; Supplier Part Number 2: *; Package: 0402
U11 U21 = IC MCU EFM8BB21F16G-C 20QFN: as U31 on sheet mcu; Digikey Part Number: 336-4743-1-ND; Package: 20QFN
U12 U22 = IC MOSDRV FD6288Q 24QFN: as U32 on sheet mcu; Digikey Part Number: N/A; Package: 24QFN(4x4); Manufacturer Product Number: FD6288Q

## Nets that join several sheets
+3V3: main (3v.P$1 C04.P$1 U0.2 U2.3), mcu (6 pins), mcu2 (6 pins)
GND: main (79 pins), mcu (24 pins), mcu2 (24 pins)
PVDD: main (C03.P$1 L00.2 R02.P$2 U0.3), mcu (10 pins), mcu2 (10 pins)
M1a: main (8 pins), mcu2 (C13.P$2 R30.P$1 U12.18)
M1a_HG: main (M1aH.4), mcu2 (R21.P$2)
M1a_LG: main (M1aL.4), mcu2 (R24.P$2 R25.P$1)
M1b: main (8 pins), mcu2 (C14.P$2 R33.P$1 U12.15)
M1b_HG: main (M1bH.4), mcu2 (R22.P$2)
M1b_LG: main (M1bL.4), mcu2 (R26.P$2 R27.P$1)
M1c: main (8 pins), mcu2 (C15.P$2 R36.P$1 U12.12)
M1c_HG: main (M1cH.4), mcu2 (R23.P$2)
M1c_LG: main (M1cL.4), mcu2 (R28.P$2 R29.P$1)
M2a: main (8 pins), mcu2 (C23.P$2 R50.P$1 U22.18)
M2a_HG: main (M2aH.4), mcu2 (R41.P$2)
M2a_LG: main (M2aL.4), mcu2 (R44.P$2 R45.P$1)
M2b: main (8 pins), mcu2 (C24.P$2 R53.P$1 U22.15)
M2b_HG: main (M2bH.4), mcu2 (R42.P$2)
M2b_LG: main (M2bL.4), mcu2 (R46.P$2 R47.P$1)
M2c: main (8 pins), mcu2 (C25.P$2 R56.P$1 U22.12)
M2c_HG: main (M2cH.4), mcu2 (R43.P$2)
M2c_LG: main (M2cL.4), mcu2 (R48.P$2 R49.P$1)
M3a: main (8 pins), mcu (C33.P$2 R70.P$1 U32.18)
M3a_HG: main (M3aH.4), mcu (R61.P$2)
M3a_LG: main (M3aL.4), mcu (R64.P$2 R65.P$1)
M3b: main (8 pins), mcu (C34.P$2 R73.P$1 U32.15)
M3b_HG: main (M3bH.4), mcu (R62.P$2)
M3b_LG: main (M3bL.4), mcu (R66.P$2 R67.P$1)
M3c: main (8 pins), mcu (C35.P$2 R76.P$1 U32.12)
M3c_HG: main (M3cH.4), mcu (R63.P$2)
M3c_LG: main (M3cL.4), mcu (R68.P$2 R69.P$1)
M4a: main (8 pins), mcu (C43.P$2 R90.P$1 U42.18)
M4a_HG: main (M4aH.4), mcu (R81.P$2)
M4a_LG: main (M4aL.4), mcu (R84.P$2 R85.P$1)
M4b: main (8 pins), mcu (C44.P$2 R93.P$1 U42.15)
M4b_HG: main (M4bH.4), mcu (R82.P$2)
M4b_LG: main (M4bL.4), mcu (R86.P$2 R87.P$1)
M4c: main (8 pins), mcu (C45.P$2 R96.P$1 U42.12)
M4c_HG: main (M4cH.4), mcu (R83.P$2)
M4c_LG: main (M4cL.4), mcu (R88.P$2 R89.P$1)